# Altium project KNX_MCU_24CH_V1.2.PrjPcb
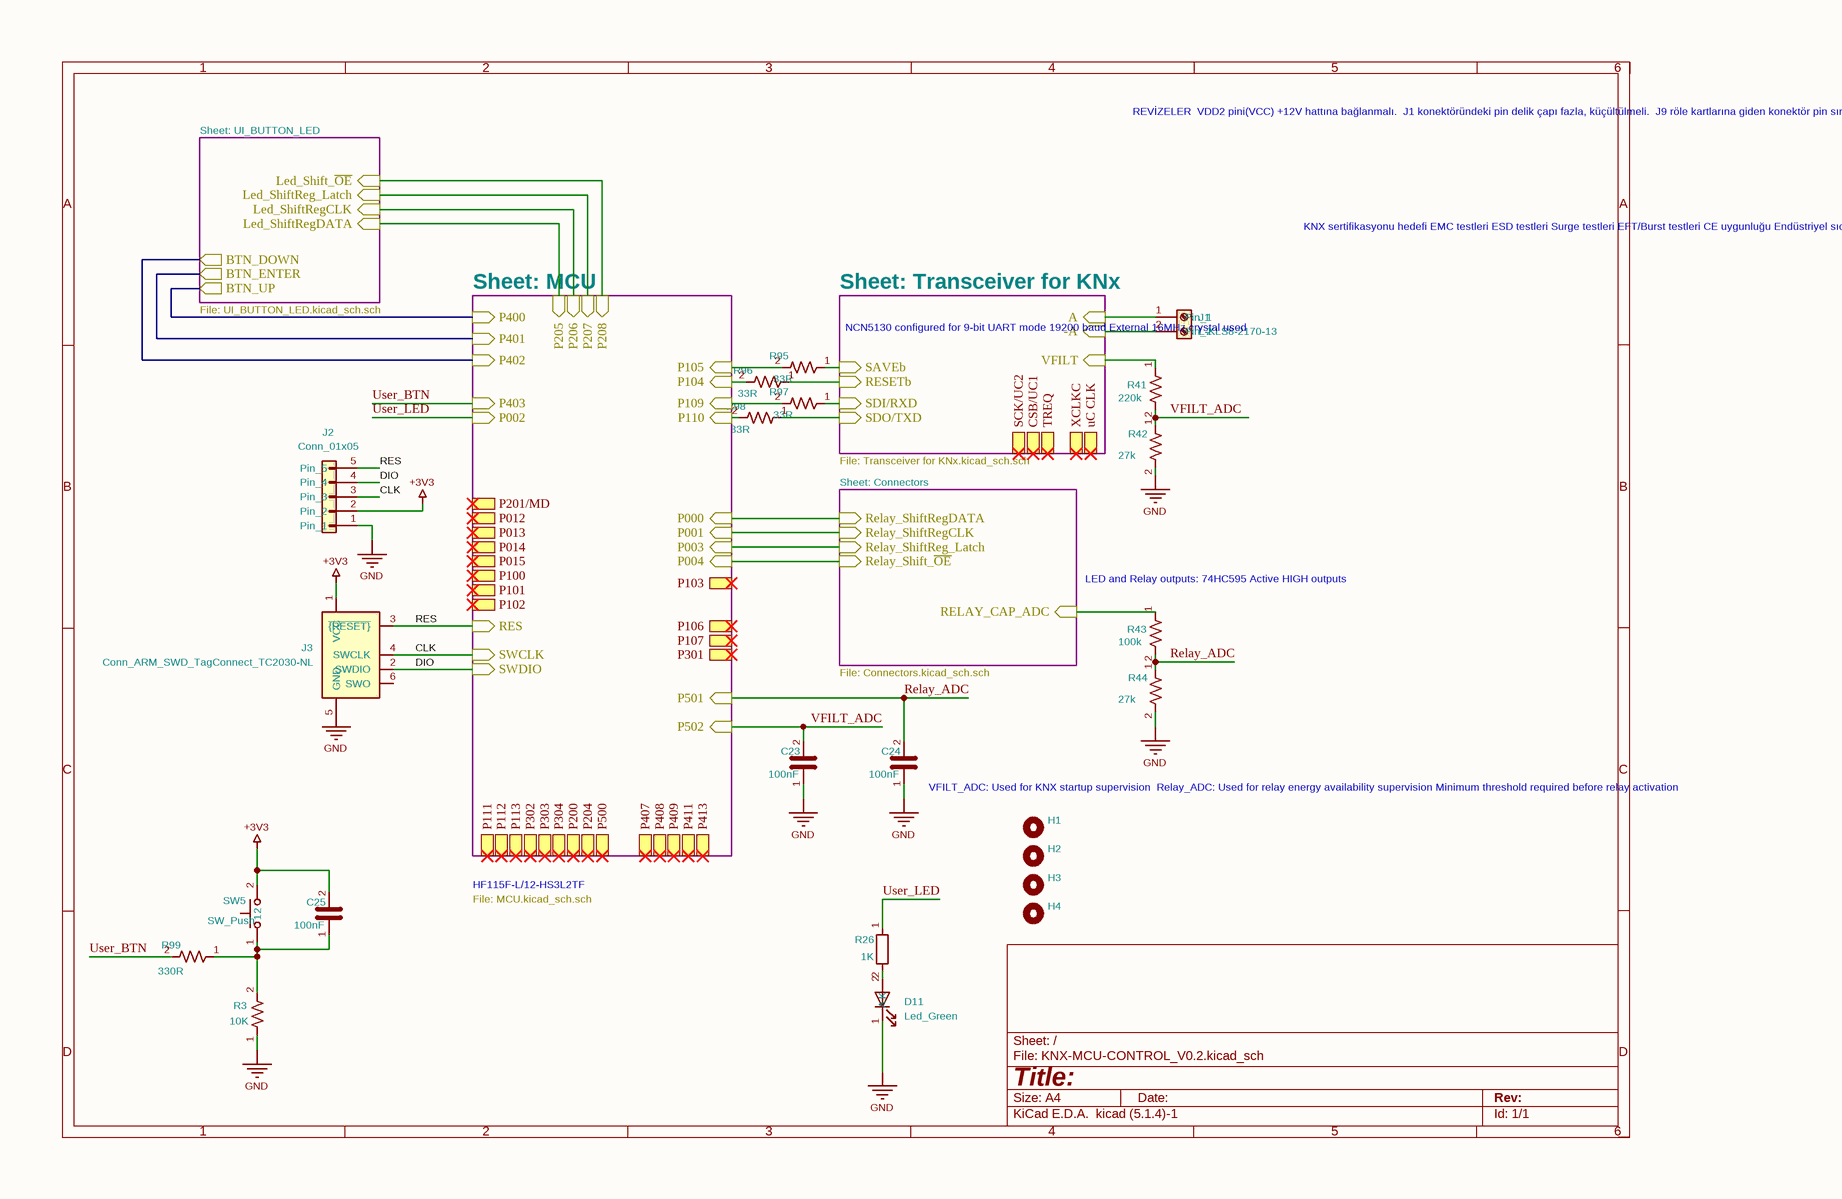
[diagram p0: KNX-MCU-CONTROL_V0.2.SchDoc]
5 sheets, 138 parts. Net scope: hierarchical (ports join the sheet entries above them; power ports are global).
Board file: KNX_MCU_24CH_V1.2.PcbDoc
Sheets:
  KNX-MCU-CONTROL_V0.2.SchDoc
    Transceiver for KNx = Transceiver for KNx.SchDoc
    Connectors = Connectors.SchDoc
    MCU = MCU.SchDoc
    UI_BUTTON_LED = UI_BUTTON_LED.SchDoc

## Sheet KNX-MCU-CONTROL_V0.2.SchDoc
size 297 x 209 mm

### Parts
C23  100nF  [C_0603_1608Metric]
C24  100nF  [C_0603_1608Metric]
C25  100nF  [C_0603_1608Metric]
D11  Led_Green  [LED_D3.0mm]
H1  YP-1132-20-0-N-0  [MountingHole_3mm]  (value not drawn)
H2  YP-1132-20-0-N-0  [MountingHole_3mm]  (value not drawn)
H3  YP-1132-20-0-N-0  [MountingHole_3mm]  (value not drawn)
H4  YP-1132-20-0-N-0  [MountingHole_3mm]  (value not drawn)
J1  L-KLS8-2170-13  [Samtec_HPM-02-01-x-S_Straight_1x02_Pitch5.08mm]
J2  Conn_01x05  [PinHeader_1x05_P2.54mm_Vertical]  (no BOM)
J3  Conn_ARM_SWD_TagConnect_TC2030-NL  [Tag-Connect_TC2030-IDC-NL_2x03_P1.27mm_Vertical]  (no BOM)
R3  10K  [R_0603_1608Metric]
R26  1K  [R_0603_1608Metric]
R41  220k  [R_0603_1608Metric]
R42  27k  [R_0603_1608Metric]
R43  100k  [R_0603_1608Metric]
R44  27k  [R_0603_1608Metric]
R95  33R  [R_0603_1608Metric]
R96  33R  [R_0603_1608Metric]
R97  33R  [R_0603_1608Metric]
R98  33R  [R_0603_1608Metric]
R99  330R  [R_0603_1608Metric]
SW5  SW_Push  [SW_SPST_Omron_B3FS-100xP]

### Sub-sheets
Connectors = Connectors.SchDoc: RELAY_CAP_ADC (in), Relay_ShiftRegCLK (in), Relay_ShiftRegDATA (in), Relay_Shift_~{OE} (in), Relay_ShiftReg_Latch (in)
MCU = MCU.SchDoc: P000 (in), P001 (in), P003 (in), P104 (in), P105 (in), P109 (in), P110 (in), P400 (in), P401 (in), P402 (in), P501 (in), RES (in), SWCLK (in), SWDIO (in), P004 (in), P205 (in), P206 (in), P207 (in), P208 (in), P403 (in), P002 (in), P502 (in), P012, P013, P014, P015, P100, P101, P102, P103, P106, P107, P301, P111, P112, P113, P302, P303, P304, P200, P204, P500, P407, P408, P409, P411, P413, P201/MD
Transceiver for KNx = Transceiver for KNx.SchDoc: RESETb (in), SAVEb (in), SDI/RXD (in), SDO/TXD (in), VFILT (in), A (in), -A (in), SCK/UC2, CSB/UC1, TREQ, XCLKC, uC CLK
UI_BUTTON_LED = UI_BUTTON_LED.SchDoc: BTN_DOWN (out), BTN_ENTER (out), BTN_UP (out), Led_ShiftRegCLK (in), Led_ShiftRegDATA (in), Led_ShiftReg_Latch (in), Led_Shift_~{OE} (in)

### Nets
+3V3: C25.2 J2.2(Pin_2) J3.1(VCC) SW5.2
GND: C23.1 C24.1 D11.1(K) J2.1(Pin_1) J3.5(GND) R3.1 R42.2 R44.2
-A: J1.2(Pin_2) ; sheet Transceiver for KNx/-A
A: J1.1(Pin_1) ; sheet Transceiver for KNx/A
BTN_DOWN: sheet MCU/P402, sheet UI_BUTTON_LED/BTN_DOWN
BTN_ENTER: sheet MCU/P401, sheet UI_BUTTON_LED/BTN_ENTER
BTN_UP: sheet MCU/P400, sheet UI_BUTTON_LED/BTN_UP
CLK: J2.3(Pin_3) J3.4(SWCLK) ; sheet MCU/SWCLK
DIO: J2.4(Pin_4) J3.2(SWDIO) ; sheet MCU/SWDIO
Led_ShiftRegDATA: sheet MCU/P205, sheet UI_BUTTON_LED/Led_ShiftRegDATA
P000: sheet Connectors/Relay_ShiftRegDATA, sheet MCU/P000
P001: sheet Connectors/Relay_ShiftRegCLK, sheet MCU/P001
P003: sheet Connectors/Relay_ShiftReg_Latch, sheet MCU/P003
P004: sheet Connectors/Relay_Shift_~{OE}, sheet MCU/P004
P104: R96.2 ; sheet MCU/P104
P105: R95.2 ; sheet MCU/P105
P109: R97.2 ; sheet MCU/P109
P110: R98.2 ; sheet MCU/P110
Relay_ADC: C24.2 R43.2 R44.1 ; sheet MCU/P501
RELAY_CAP_ADC: R43.1 ; sheet Connectors/RELAY_CAP_ADC
RES: J2.5(Pin_5) J3.3(~{{RESET}}) ; sheet MCU/RES
RESETb: R96.1 ; sheet Transceiver for KNx/RESETb
SAVEb: R95.1 ; sheet Transceiver for KNx/SAVEb
SDI/RXD: R97.1 ; sheet Transceiver for KNx/SDI/RXD
SDO/TXD: R98.1 ; sheet Transceiver for KNx/SDO/TXD
ShiftReg_Latch: sheet MCU/P207, sheet UI_BUTTON_LED/Led_ShiftReg_Latch
ShiftReg_~{{OE}}: sheet MCU/P208, sheet UI_BUTTON_LED/Led_Shift_~{OE}
ShiftRegCLK: sheet MCU/P206, sheet UI_BUTTON_LED/Led_ShiftRegCLK
User_BTN: R99.2 ; sheet MCU/P403
User_LED: R26.1 ; sheet MCU/P002
VFILT: R41.1 ; sheet Transceiver for KNx/VFILT
VFILT_ADC: C23.2 R41.2 R42.1 ; sheet MCU/P502
NetC25_1: C25.1 R3.2 R99.1 SW5.1
NetD11_2: D11.2(A) R26.2

Not connected (* = marked no-connect by the designer): J3 6(SWO)

### Notes on the sheet
- Sheet: UI_BUTTON_LED
- REVİZELER
  VDD2 pini(VCC) +12V hattına bağlanmalı.
  J1 konektöründeki pin delik çapı fazla, küçültülmeli.
  J9 röle kartlarına giden konektör pin sırası uyuşmuyor kontrol edilmeli.
  VFILT_ADC P500 den P502 ye bağlanmalı.
  16ch da kapasitör yetmiyor artırmak gerekli
  24ch da kapasitör bankası SMD kılıfı var mı bi bak.
- KNX sertifikasyonu hedefi
  EMC testleri
  ESD testleri
  Surge testleri
  EFT/Burst testleri
  CE uygunluğu
  Endüstriyel sıcaklık aralığı
  Uzun süreli saha kullanımı
  Fan-in akımı 20-40mA sınıfı düşünülüyor
  PCB'de geniş GND poligonları ve düşük EMI hedefleniyor
- File: UI_BUTTON_LED.kicad_sch.sch
- Sheet: MCU
- Sheet: Transceiver for KNx
- (near J1) NCN5130 configured for 9-bit UART mode
  19200 baud
  External 16MHz crystal used
- File: Transceiver for KNx.kicad_sch.sch
- Sheet: Connectors
- (near R43) LED and Relay outputs:
  74HC595
  Active HIGH outputs
- File: Connectors.kicad_sch.sch
- VFILT_ADC:
  Used for KNX startup supervision
  Relay_ADC:
  Used for relay energy availability supervision
  Minimum threshold required before relay activation
- File: MCU.kicad_sch.sch
- HF115F-L/12-HS3L2TF
- 1
- 2
- 3
- 4
- 5
- 6
- A
- B
- C
- D
- Title:
- File: KNX-MCU-CONTROL_V0.2.kicad_sch
- Sheet: /
- KiCad E.D.A.  kicad (5.1.4)-1
- Size: A4
- Date:
- Rev:
- Id: 1/1

### Library data of the parts
C23 C24 = C_1: Manufacturer Part Number: CL10B104KB8NNNC; Manufacturer: Samsung Electro-Mechanics; Value: 100nF; Footprint: Capacitor_SMD:C_0603_1608Metric
C25 = C_3: Manufacturer Part Number: CC0603KRX7R9BB104; Manufacturer: YAGEO; Value: 100nF; Footprint: Capacitor_SMD:C_0603_1608Metric
D11 = LED: Manufacturer Part Number: TZ-L2-03YYBYG1GDJ30-001; Manufacturer: TUOZHAN; Value: Led_Green; Footprint: LED_THT:LED_D3.0mm
H1-H4 = MountingHole: YP-1132 Geçmeli Yükseltme Parçası (3.2mm delik için) İki Tarafı Kilitli; Manufacturer: Altınkaya; Value: MountingHole; Footprint: MountingHole:MountingHole_3mm; Manufacturer Part Number: YP-1132-20-0-N-0
J1 = Screw_Terminal_01x02: Manufacturer: KLS ELECTRONIC; Manufacturer Part Number: L-KLS8-2170-13; Value: L-KLS8-2170-13; Footprint: Connector_Samtec_HPM_THT:Samtec_HPM-02-01-x-S_Straight_1x02_Pitch5.08mm
R3 = R_US: Manufacturer Part Number: FRC0603J103TS; Manufacturer: FOJAN; Value: 10K; Footprint: Resistor_SMD:R_0603_1608Metric
R26 = R_7: Manufacturer Part Number: SCR0603J1K; Manufacturer: VO; Value: 1K; Footprint: Resistor_SMD:R_0603_1608Metric
R41 = R_US: Manufacturer Part Number: ERJ3EKF2203V; Manufacturer: PANASONIC; Value: 220k; Footprint: Resistor_SMD:R_0603_1608Metric
R42 R44 = R_US: Manufacturer Part Number: ERJ3EKF2702V; Manufacturer: PANASONIC; Value: 27k; Footprint: Resistor_SMD:R_0603_1608Metric
R43 = R_US: Manufacturer Part Number: RC0603FR-07100KL; Manufacturer: YAGEO; Value: 100k; Footprint: Resistor_SMD:R_0603_1608Metric
R95-R98 = R_US: Manufacturer Part Number: 0603SAF330JT5E; Manufacturer: ROYALOHM; Value: 33R; Footprint: Resistor_SMD:R_0603_1608Metric
R99 = R_US: Manufacturer Part Number: FRC0603J331 TS; Manufacturer: FOJAN; Value: 330R; Footprint: Resistor_SMD:R_0603_1608Metric
SW5 = SW_Push: Manufacturer Part Number: KH-12X12X8H-SMT; Manufacturer: kinghelm; Value: SW_Push; Footprint: Button_Switch_SMD:SW_SPST_Omron_B3FS-100xP
J2 = Conn_01x05: Value: Conn_01x05; Footprint: Connector_PinHeader_2.54mm:PinHeader_1x05_P2.54mm_Vertical
J3 = Conn_ARM_SWD_TagConnect_TC2030-NL: Value: Conn_ARM_SWD_TagConnect_TC2030-NL; Footprint: Connector:Tag-Connect_TC2030-IDC-NL_2x03_P1.27mm_Vertical

## Sheet Transceiver for KNx.SchDoc
size 297 x 209 mm
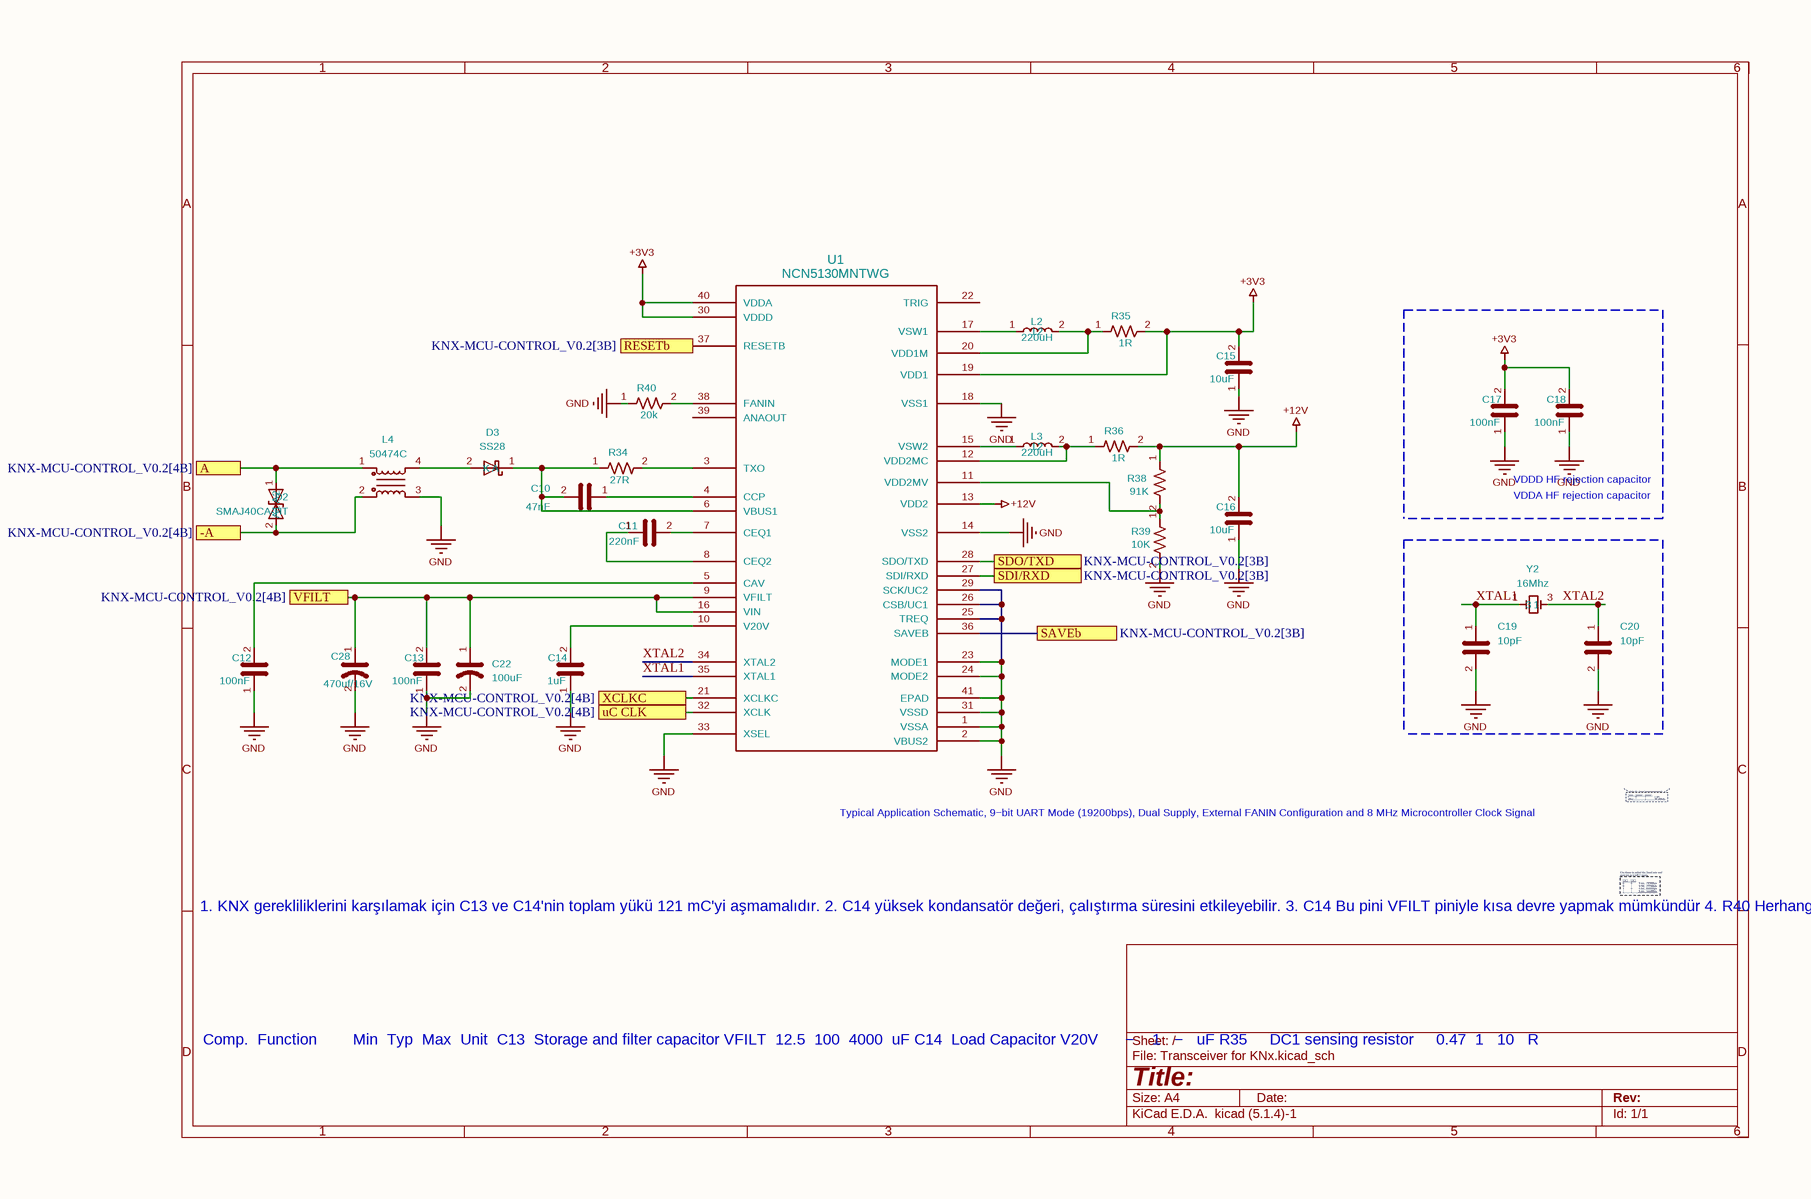
[diagram p1: Transceiver for KNx.SchDoc]

### Parts
C10  47nF  [C_0603_1608Metric]
C11  220nF  [C_0603_1608Metric]
C12  100nF  [C_0603_1608Metric]
C13  100nF  [C_0603_1608Metric]
C14  1uF  [C_0603_1608Metric]
C15  10uF  [C_0805_2012Metric]
C16  10uF  [C_0805_2012Metric]
C17  100nF  [C_0603_1608Metric]
C18  100nF  [C_0603_1608Metric]
C19  10pF  [C_0603_1608Metric]
C20  10pF  [C_0603_1608Metric]
C22  100uF  [CP_Elec_8x10]
C28  470uf/16V  [CP_Elec_8x10]
D2  SMAJ40CA-HT  [D_SMA]
D3  SS28  [D_SMA]
L2  220uH  [L_APV_ANR6028]
L3  220uH  [L_APV_ANR6028]
L4  50474C  [L_CommonMode_50474C_7.5x5.9mm]
R34  27R  [R_2512_6332Metric]
R35  1R  [R_0805_2012Metric]
R36  1R  [R_0805_2012Metric]
R38  91K  [R_0603_1608Metric]
R39  10K  [R_0603_1608Metric]
R40  20k  [R_0603_1608Metric]
U1  NCN5130MNTWG  [QFN40_485AU-01_ONS]
Y2  16Mhz  [Crystal_SMD_SeikoEpson_FA238V-4Pin_3.2x2.5mm]

### Ports
-A (see KNX-MCU-CONTROL_V0.2[4B]), A (see KNX-MCU-CONTROL_V0.2[4B]), RESETb (see KNX-MCU-CONTROL_V0.2[3B]), SAVEb (see KNX-MCU-CONTROL_V0.2[3B]), SDI/RXD (see KNX-MCU-CONTROL_V0.2[3B]), SDO/TXD (see KNX-MCU-CONTROL_V0.2[3B]), uC CLK (see KNX-MCU-CONTROL_V0.2[4B]), VFILT (see KNX-MCU-CONTROL_V0.2[4B]), XCLKC (see KNX-MCU-CONTROL_V0.2[4B])

### Nets
+3V3: C15.2 C17.2 C18.2 R35.2 U1.19(VDD1) U1.30(VDDD) U1.40(VDDA)
+12V: C16.2 R36.2 R38.1 U1.13(VDD2)
GND: C12.1 C13.1 C14.1 C15.1 C16.1 C17.1 C18.1 C19.2 C20.2 C22.2 C28.2 L4.3 R39.2 R40.1 U1.1(VSSA) U1.2(VBUS2) U1.14(VSS2) U1.18(VSS1) U1.23(MODE1) U1.24(MODE2) U1.25(TREQ) U1.26(CSB/UC1) U1.29(SCK/UC2) U1.31(VSSD) U1.33(XSEL) U1.41(EPAD)
-A: D2.2(A2) L4.2 ; port -A
A: D2.1(A1) L4.1 ; port A
RESETb: U1.37(RESETB) ; port RESETb
SAVEb: U1.36(SAVEB) ; port SAVEb
SDI/RXD: U1.27(SDI/RXD) ; port SDI/RXD
SDO/TXD: U1.28(SDO/TXD) ; port SDO/TXD
uC CLK: U1.32(XCLK) ; port uC CLK
VFILT: C13.2 C22.1 C28.1 U1.9(VFILT) U1.16(VIN) ; port VFILT
XCLKC: U1.21(XCLKC) ; port XCLKC
XTAL1: C19.1 U1.35(XTAL1) Y2.1
XTAL2: C20.1 U1.34(XTAL2) Y2.3
NetC10_1: C10.1 U1.4(CCP)
NetC10_2: C10.2 D3.1(K) R34.1 U1.6(VBUS1)
NetC11_1: C11.1 U1.8(CEQ2)
NetC11_2: C11.2 U1.7(CEQ1)
NetC12_2: C12.2 U1.5(CAV)
NetC14_2: C14.2 U1.10(V20V)
NetD3_2: D3.2(A) L4.4
NetL2_1: L2.1 U1.17(VSW1)
NetL2_2: L2.2 R35.1 U1.20(VDD1M)
NetL3_1: L3.1 U1.15(VSW2)
NetL3_2: L3.2 R36.1 U1.12(VDD2MC)
NetR34_2: R34.2 U1.3(TXO)
NetR38_2: R38.2 R39.1 U1.11(VDD2MV)
NetR40_2: R40.2 U1.38(FANIN)

Not connected (* = marked no-connect by the designer): U1 22(TRIG) 39(ANAOUT)

### Notes on the sheet
- VDDA HF rejection capacitor
- VDDD HF rejection capacitor
- Typical Application Schematic, 9−bit UART Mode (19200bps), Dual Supply, External FANIN Configuration
  and 8 MHz Microcontroller Clock Signal
- 1. KNX gerekliliklerini karşılamak için C13 ve C14'nin toplam yükü 121 mC'yi aşmamalıdır.
  2. C14 yüksek kondansatör değeri, çalıştırma süresini etkileyebilir.
  3. C14 Bu pini VFILT piniyle kısa devre yapmak mümkündür
  4. R40 Herhangi bir direnç bağlanmamışsa veya 3,3 V'a çekilmemişse, KNX cihazı 10 mA'lık bir veri
  yolu yükü olarak sertifikalandırılmalıdır. Toprağa kısa devre yapıldığında, KNX cihazı
  20 mA'lık bir veri yolu yükü olarak sertifikalandırılmalıdır. Toprağa 10 k ile 93,1 k arasında
  bir direnç bağlanırsa, cihaz 10 mA (42,2 k), 20 mA (20 k), 30 mA (13,3 k) veya 40 mA (10 k) bus yükü olarak sertifikalandırılmalıdır.
- Comp. 	Function							 Min	 Typ	 Max 	Unit
  C13 	Storage and filter capacitor VFILT 	12.5 	100 	4000 	uF
  C14 	Load Capacitor V20V					 − 		 1 		− 		uF
  R35	    DC1 sensing resistor 				0.47	 1 		10  	R
- 1
- 2
- 3
- 4
- 5
- 6
- A
- B
- C
- D
- Title:
- File: Transceiver for KNx.kicad_sch
- Sheet: /
- KiCad E.D.A.  kicad (5.1.4)-1
- Size: A4
- Date:
- Rev:
- Id: 1/1

### Library data of the parts
C10 = C_3: Manufacturer Part Number: CL10B473KB8NNNC; Manufacturer: SAMSUNG; Value: 47nF; Footprint: Capacitor_SMD:C_0603_1608Metric
C11 = C_3: Manufacturer Part Number: CL10B224KB8NNNC; Manufacturer: Samsung Electro-Mechanics; Value: 220nF; Footprint: Capacitor_SMD:C_0603_1608Metric
C12 C13 C17 C18 = C_1: as C23 on sheet KNX-MCU-CONTROL_V0.2; Value: 100nF; Footprint: Capacitor_SMD:C_0603_1608Metric
C14 = C_3: Manufacturer Part Number: CL10B105KP8NNNC; Manufacturer: Samsung Electro-Mechanics; Value: 1uF; Footprint: Capacitor_SMD:C_0603_1608Metric
C15 C16 = C_3: Manufacturer Part Number: CL21B106KOQNNNE; Manufacturer: Samsung Electro-Mechanics; Value: 10uF; Footprint: Capacitor_SMD:C_0805_2012Metric
C19 C20 = 20pF_0402_50V_5%: Manufacturer Part Number: CL10C100JB8NNNC; Manufacturer: Samsung Electro-Mechanics; Value: 10pF; Footprint: Capacitor_SMD:C_0603_1608Metric
C22 = C_US: Manufacturer Part Number: CD035M101F10PKKKV00A; Manufacturer: SUSCON; Value: 100uF; Footprint: Capacitor_SMD:CP_Elec_8x10
C28 = C_US: CAP.EL.470uF 16V 8x10 105C SMD; Manufacturer Part Number: EEEFK1C471P; Manufacturer: PANASONIC(EUROPE); Value: 470uf/16V; Footprint: Capacitor_SMD:CP_Elec_8x10
D2 = D_TVS: Manufacturer: HOTTECH; Manufacturer Part Number: SMAJ40CA-HT; Value: SMAJ40CA-HT; Footprint: Diode_SMD:D_SMA
D3 = SS28: Manufacturer Part Number: SS18-HT; Manufacturer: HOTTECH; Value: SS28; Footprint: Diode_SMD:D_SMA
L2 L3 = L: Manufacturer Part Number: NR6028-221M; Manufacturer: CORE MASTER; Value: 220uH; Footprint: Inductor_SMD:L_APV_ANR6028
L4 = Choke_Wurth_WE-CNSW_744232090: Manufacturer: muRata; Manufacturer Part Number: 50474C; Value: 50474C; Footprint: Me_Library:L_CommonMode_50474C_7.5x5.9mm
R34 = R_US: Manufacturer Part Number: HP122WF270JT4E; Manufacturer: ROYALOHM; Value: 27R; Footprint: Resistor_SMD:R_2512_6332Metric
R35 R36 = R_US: Manufacturer Part Number: ERJ6RQF1R0V; Manufacturer: PANASONIC; Value: 1R; Footprint: Resistor_SMD:R_0805_2012Metric
R38 = R_US: Manufacturer Part Number: 0603SAF9102T5E; Manufacturer: ROYALOHM; Value: 91K; Footprint: Resistor_SMD:R_0603_1608Metric
R39 = R_US: Manufacturer Part Number: PS03W4F1002T5E; Manufacturer: ROYALOHM; Value: 10K; Footprint: Resistor_SMD:R_0603_1608Metric
R40 = R_US: Manufacturer Part Number: 0603SAF2002T5E; Manufacturer: ROYALOHM; Value: 20k; Footprint: Resistor_SMD:R_0603_1608Metric
U1 = NCN5130MNTWG: Manufacturer: onsemi; Manufacturer Part Number: NCN5130MNTWG; Value: NCN5130MNTWG; Footprint: Me_Library:QFN40_485AU-01_ONS
Y2 = Crystal: Manufacturer Part Number: RH100-16.000-10-1010-EXT; Manufacturer: RALTRON; Value: 16Mhz; Footprint: Crystal:Crystal_SMD_SeikoEpson_FA238V-4Pin_3.2x2.5mm

## Sheet Connectors.SchDoc
size 209 x 148 mm
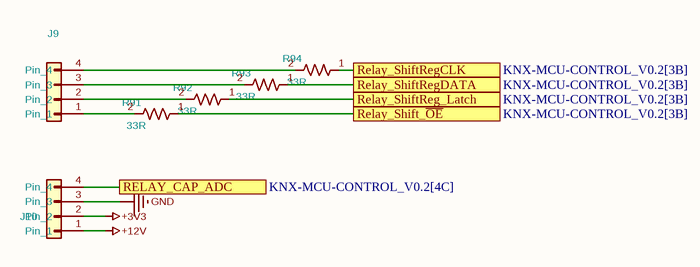
[diagram p2: Connectors.SchDoc]

### Parts
J9  DK501-1X6SBT-3X13MM  [PinHeader_1x04_P2.54mm_Vertical]  (value not drawn)
J10  DK501-1X6SBT-3X13MM  [PinHeader_1x04_P2.54mm_Vertical]  (value not drawn)
R91  33R  [R_0603_1608Metric]
R92  33R  [R_0603_1608Metric]
R93  33R  [R_0603_1608Metric]
R94  33R  [R_0603_1608Metric]

### Ports
RELAY_CAP_ADC (see KNX-MCU-CONTROL_V0.2[4C]), Relay_Shift_~{OE} (see KNX-MCU-CONTROL_V0.2[3B]), Relay_ShiftReg_Latch (see KNX-MCU-CONTROL_V0.2[3B]), Relay_ShiftRegCLK (see KNX-MCU-CONTROL_V0.2[3B]), Relay_ShiftRegDATA (see KNX-MCU-CONTROL_V0.2[3B])

### Nets
+3V3: J10.2(Pin_2)
+12V: J10.1(Pin_1)
GND: J10.3(Pin_3)
P000: R93.1 ; port Relay_ShiftRegDATA
P001: R94.1 ; port Relay_ShiftRegCLK
P003: R92.1 ; port Relay_ShiftReg_Latch
P004: R91.1 ; port Relay_Shift_~{OE}
RELAY_CAP_ADC: J10.4(Pin_4) ; port RELAY_CAP_ADC
NetJ9_1: J9.1(Pin_1) R91.2
NetJ9_2: J9.2(Pin_2) R92.2
NetJ9_3: J9.3(Pin_3) R93.2
NetJ9_4: J9.4(Pin_4) R94.2

### Notes on the sheet
- 1
- 2
- 3
- 4
- A
- B
- Title:
- File: Connectors.kicad_sch
- Sheet: /
- C
- KiCad E.D.A.  kicad (5.1.4)-1
- Size: A5
- Date:
- Rev:
- Id: 1/1

### Library data of the parts
J9 J10 = Conn_01x04: PIN HEADER 6PIN(1x6) 2.54mm THT V/T 3X13MM; Manufacturer: OEM; Value: Conn_01x04; Footprint: Connector_PinHeader_2.54mm:PinHeader_1x04_P2.54mm_Vertical; Manufacturer Part Number: DK501-1X6SBT-3X13MM
R91-R94 = R_US: Manufacturer Part Number: RC0603JR-0733RL; Manufacturer: YAGEO; Value: 33R; Footprint: Resistor_SMD:R_0603_1608Metric

## Sheet MCU.SchDoc
size 297 x 209 mm
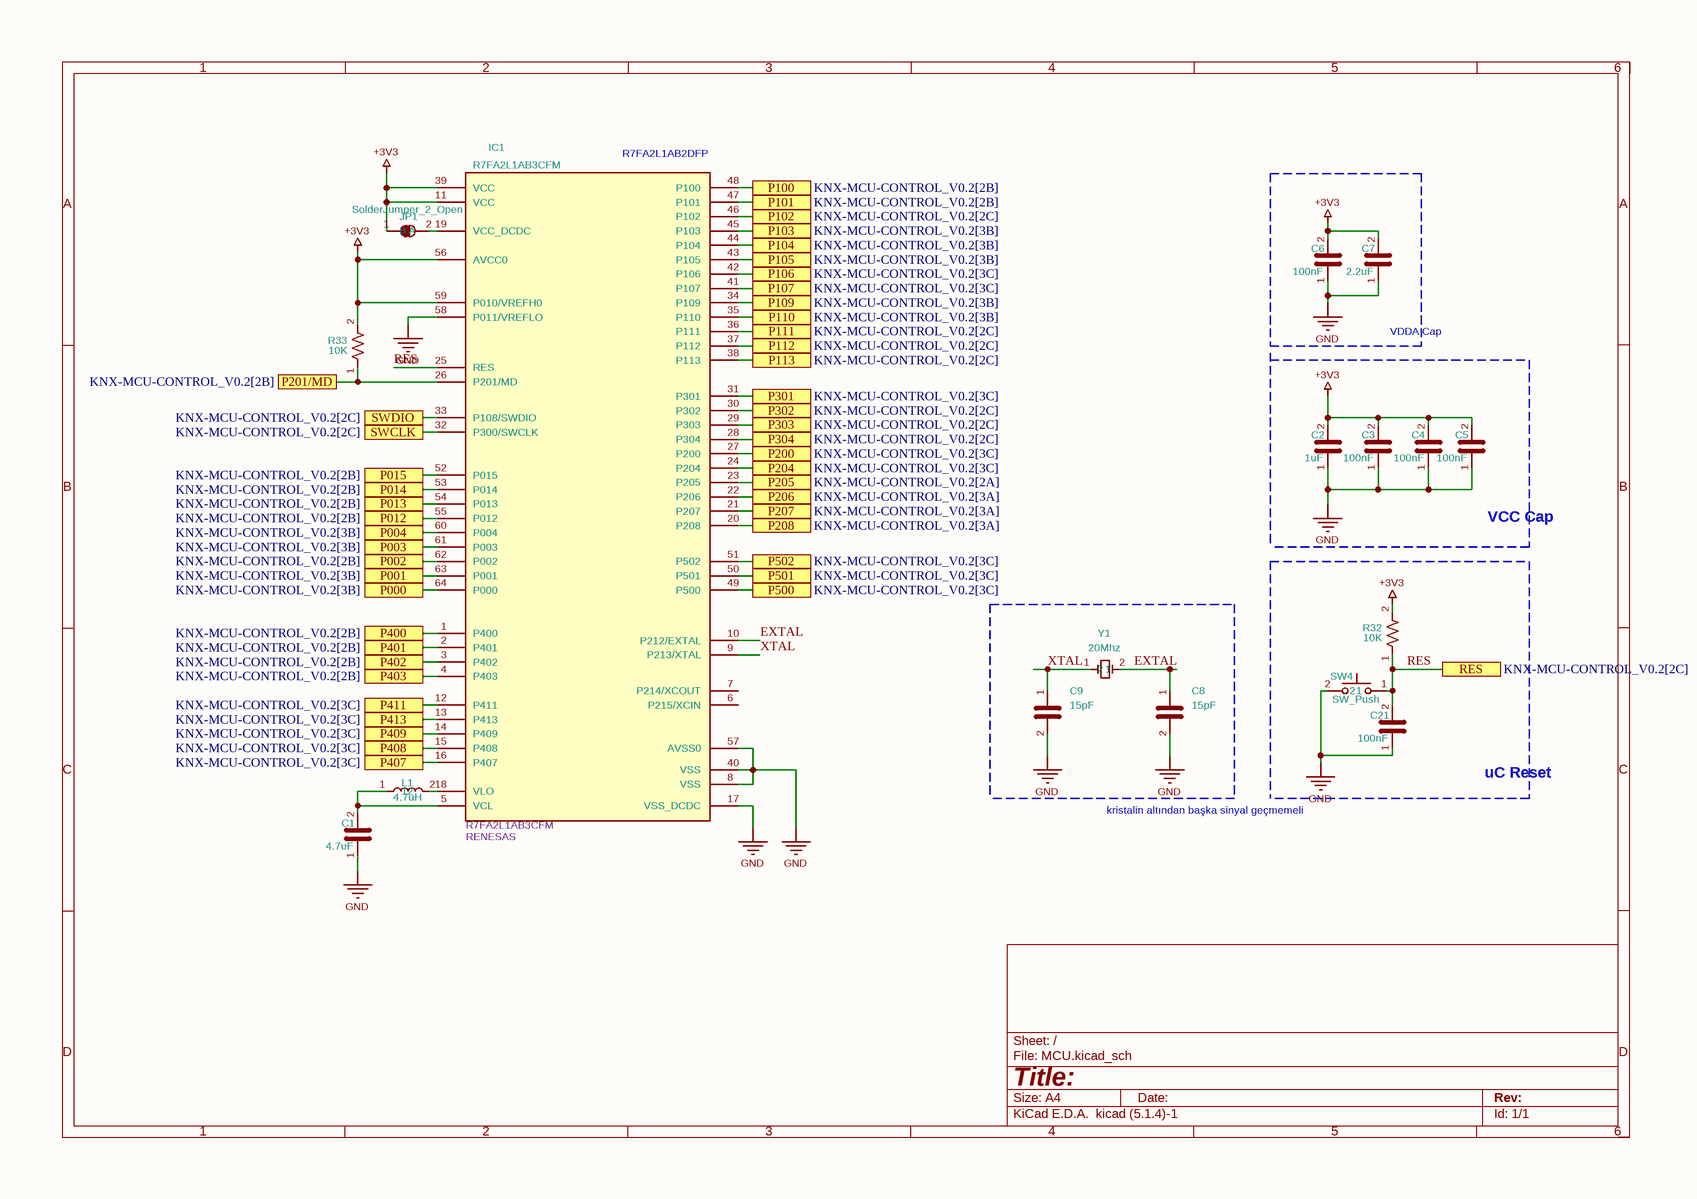
[diagram p3: MCU.SchDoc]

### Parts
C1  4.7uF  [C_0603_1608Metric]
C2  1uF  [C_0603_1608Metric]
C3  100nF  [C_0603_1608Metric]
C4  100nF  [C_0603_1608Metric]
C5  100nF  [C_0603_1608Metric]
C6  100nF  [C_0603_1608Metric]
C7  2.2uF  [C_0603_1608Metric]
C8  15pF  [C_0603_1608Metric]
C9  15pF  [C_0603_1608Metric]
C21  100nF  [C_0603_1608Metric]
IC1  Manufacturer: RENESAS  [LQFP-64_10x10mm_P0.5mm]  (hidden comment: R7FA2L1AB3CFM)
JP1  SolderJumper_2_Open  [SolderJumper-2_P1.3mm_Open_TrianglePad1.0x1.5mm]  (no BOM)
L1  4.7uH  [L_APV_ANR5012]
R32  10K  [R_0603_1608Metric]
R33  10K  [R_0603_1608Metric]
SW4  value SW_Push  [SW_SPST_CK_RS282G05A3]  (hidden comment: HX 3x6x2.5A-2.5N)
Y1  20Mhz  [Crystal_SMD_SeikoEpson_FA238-4Pin_3.2x2.5mm]

### Blocks framed on the sheet
VDDA Cap: C6 C7
uC Reset: C21 R32 SW4

### Ports
P000 (see KNX-MCU-CONTROL_V0.2[3B]), P001 (see KNX-MCU-CONTROL_V0.2[3B]), P002 (see KNX-MCU-CONTROL_V0.2[2B]), P003 (see KNX-MCU-CONTROL_V0.2[3B]), P004 (see KNX-MCU-CONTROL_V0.2[3B]), P012 (see KNX-MCU-CONTROL_V0.2[2B]), P013 (see KNX-MCU-CONTROL_V0.2[2B]), P014 (see KNX-MCU-CONTROL_V0.2[2B]), P015 (see KNX-MCU-CONTROL_V0.2[2B]), P100 (see KNX-MCU-CONTROL_V0.2[2B]), P101 (see KNX-MCU-CONTROL_V0.2[2B]), P102 (see KNX-MCU-CONTROL_V0.2[2C]), P103 (see KNX-MCU-CONTROL_V0.2[3B]), P104 (see KNX-MCU-CONTROL_V0.2[3B]), P105 (see KNX-MCU-CONTROL_V0.2[3B]), P106 (see KNX-MCU-CONTROL_V0.2[3C]), P107 (see KNX-MCU-CONTROL_V0.2[3C]), P109 (see KNX-MCU-CONTROL_V0.2[3B]), P110 (see KNX-MCU-CONTROL_V0.2[3B]), P111 (see KNX-MCU-CONTROL_V0.2[2C]), P112 (see KNX-MCU-CONTROL_V0.2[2C]), P113 (see KNX-MCU-CONTROL_V0.2[2C]), P200 (see KNX-MCU-CONTROL_V0.2[3C]), P201/MD (see KNX-MCU-CONTROL_V0.2[2B]), P204 (see KNX-MCU-CONTROL_V0.2[3C]), P205 (see KNX-MCU-CONTROL_V0.2[2A]), P206 (see KNX-MCU-CONTROL_V0.2[3A]), P207 (see KNX-MCU-CONTROL_V0.2[3A]), P208 (see KNX-MCU-CONTROL_V0.2[3A]), P301 (see KNX-MCU-CONTROL_V0.2[3C]), P302 (see KNX-MCU-CONTROL_V0.2[2C]), P303 (see KNX-MCU-CONTROL_V0.2[2C]), P304 (see KNX-MCU-CONTROL_V0.2[2C]), P400 (see KNX-MCU-CONTROL_V0.2[2B]), P401 (see KNX-MCU-CONTROL_V0.2[2B]), P402 (see KNX-MCU-CONTROL_V0.2[2B]), P403 (see KNX-MCU-CONTROL_V0.2[2B]), P407 (see KNX-MCU-CONTROL_V0.2[3C]), P408 (see KNX-MCU-CONTROL_V0.2[3C]), P409 (see KNX-MCU-CONTROL_V0.2[3C]), P411 (see KNX-MCU-CONTROL_V0.2[3C]), P413 (see KNX-MCU-CONTROL_V0.2[3C]), P500 (see KNX-MCU-CONTROL_V0.2[3C]), P501 (see KNX-MCU-CONTROL_V0.2[3C]), P502 (see KNX-MCU-CONTROL_V0.2[3C]), RES (see KNX-MCU-CONTROL_V0.2[2C]), SWCLK (see KNX-MCU-CONTROL_V0.2[2C]), SWDIO (see KNX-MCU-CONTROL_V0.2[2C])

### Nets
+3V3: C2.2 C3.2 C4.2 C5.2 C6.2 C7.2 IC1.11(VCC) IC1.39(VCC) IC1.56(AVCC0) IC1.59(P010/VREFH0) JP1.1(A) R32.2 R33.2
GND: C1.1 C2.1 C3.1 C4.1 C5.1 C6.1 C7.1 C8.2 C9.2 C21.1 IC1.8(VSS) IC1.17(VSS_DCDC) IC1.40(VSS) IC1.57(AVSS0) IC1.58(P011/VREFLO) SW4.2
BTN_DOWN: IC1.3(P402) ; port P402
BTN_ENTER: IC1.2(P401) ; port P401
BTN_UP: IC1.1(P400) ; port P400
CLK: IC1.32(P300/SWCLK) ; port SWCLK
DIO: IC1.33(P108/SWDIO) ; port SWDIO
EXTAL: C8.1 IC1.10(P212/EXTAL) Y1.2
Led_ShiftRegDATA: IC1.23(P205) ; port P205
P000: IC1.64(P000) ; port P000
P001: IC1.63(P001) ; port P001
P003: IC1.61(P003) ; port P003
P004: IC1.60(P004) ; port P004
P012: IC1.55(P012) ; port P012
P013: IC1.54(P013) ; port P013
P014: IC1.53(P014) ; port P014
P015: IC1.52(P015) ; port P015
P100: IC1.48(P100) ; port P100
P101: IC1.47(P101) ; port P101
P102: IC1.46(P102) ; port P102
P103: IC1.45(P103) ; port P103
P104: IC1.44(P104) ; port P104
P105: IC1.43(P105) ; port P105
P106: IC1.42(P106) ; port P106
P107: IC1.41(P107) ; port P107
P109: IC1.34(P109) ; port P109
P110: IC1.35(P110) ; port P110
P111: IC1.36(P111) ; port P111
P112: IC1.37(P112) ; port P112
P113: IC1.38(P113) ; port P113
P200: IC1.27(P200) ; port P200
P201/MD: IC1.26(P201/MD) R33.1 ; port P201/MD
P204: IC1.24(P204) ; port P204
P301: IC1.31(P301) ; port P301
P302: IC1.30(P302) ; port P302
P303: IC1.29(P303) ; port P303
P304: IC1.28(P304) ; port P304
P407: IC1.16(P407) ; port P407
P408: IC1.15(P408) ; port P408
P409: IC1.14(P409) ; port P409
P411: IC1.12(P411) ; port P411
P413: IC1.13(P413) ; port P413
P500: IC1.49(P500) ; port P500
Relay_ADC: IC1.50(P501) ; port P501
RES: C21.2 IC1.25(RES) R32.1 SW4.1 ; port RES
ShiftReg_Latch: IC1.21(P207) ; port P207
ShiftReg_~{{OE}}: IC1.20(P208) ; port P208
ShiftRegCLK: IC1.22(P206) ; port P206
User_BTN: IC1.4(P403) ; port P403
User_LED: IC1.62(P002) ; port P002
VFILT_ADC: IC1.51(P502) ; port P502
XTAL: C9.1 IC1.9(P213/XTAL) Y1.1
NetC1_2: C1.2 IC1.5(VCL) L1.1
NetIC1_18: IC1.18(VLO) L1.2
NetIC1_19: IC1.19(VCC_DCDC) JP1.2(B)

Not connected (* = marked no-connect by the designer): IC1 6(P215/XCIN) 7(P214/XCOUT)

### Notes on the sheet
- (near IC1) R7FA2L1AB2DFP
- VCC Cap
- kristalin altından başka sinyal geçmemeli
- 1
- 2
- 3
- 4
- 5
- 6
- A
- B
- C
- D
- Title:
- File: MCU.kicad_sch
- Sheet: /
- KiCad E.D.A.  kicad (5.1.4)-1
- Size: A4
- Date:
- Rev:
- Id: 1/1

### Library data of the parts
C1 = C_3: Manufacturer Part Number: CL10B475KQ8NQNC; Manufacturer: Samsung Electro-Mechanics; Value: 4.7uF; Footprint: Capacitor_SMD:C_0603_1608Metric
C2 = C_3: as C14 on sheet Transceiver for KNx; Value: 1uF; Footprint: Capacitor_SMD:C_0603_1608Metric
C3-C6 C21 = C_3: as C25 on sheet KNX-MCU-CONTROL_V0.2; Value: 100nF; Footprint: Capacitor_SMD:C_0603_1608Metric
C7 = C_3: Manufacturer Part Number: CL10B225KP8NNNC; Manufacturer: Samsung Electro-Mechanics; Value: 2.2uF; Footprint: Capacitor_SMD:C_0603_1608Metric
C8 C9 = 20pF_0402_50V_5%: Manufacturer Part Number: CL10C150JB8NNNC; Manufacturer: Samsung Electro-Mechanics; Value: 15pF; Footprint: Capacitor_SMD:C_0603_1608Metric
L1 = L: Manufacturer: VIKING; Manufacturer Part Number: PCD0302MT4R7; Value: 4.7uH; Footprint: Inductor_SMD:L_APV_ANR5012
R32 R33 = R_US: as R3 on sheet KNX-MCU-CONTROL_V0.2; Value: 10K; Footprint: Resistor_SMD:R_0603_1608Metric
SW4 = SW_Push: SWITCH TACTILE SPST 250gf SMD; Manufacturer: hanxia; Manufacturer Part Number: HX 3x6x2.5A-2.5N; Footprint: Button_Switch_SMD:SW_SPST_CK_RS282G05A3
Y1 = Crystal: Manufacturer Part Number: FL3P2X2P5SSC; Manufacturer: RALTRON; Value: 20Mhz; Footprint: Crystal:Crystal_SMD_SeikoEpson_FA238-4Pin_3.2x2.5mm
IC1 = R7FA2L1AB3CFM: Manufacturer Part Number: R7FA2L1AB3CFM; Value: R7FA2L1AB3CFM; Footprint: Package_QFP:LQFP-64_10x10mm_P0.5mm
JP1 = SolderJumper_2_Open: Value: SolderJumper_2_Open; Footprint: Jumper:SolderJumper-2_P1.3mm_Open_TrianglePad1.0x1.5mm

## Sheet UI_BUTTON_LED.SchDoc
size 297 x 209 mm
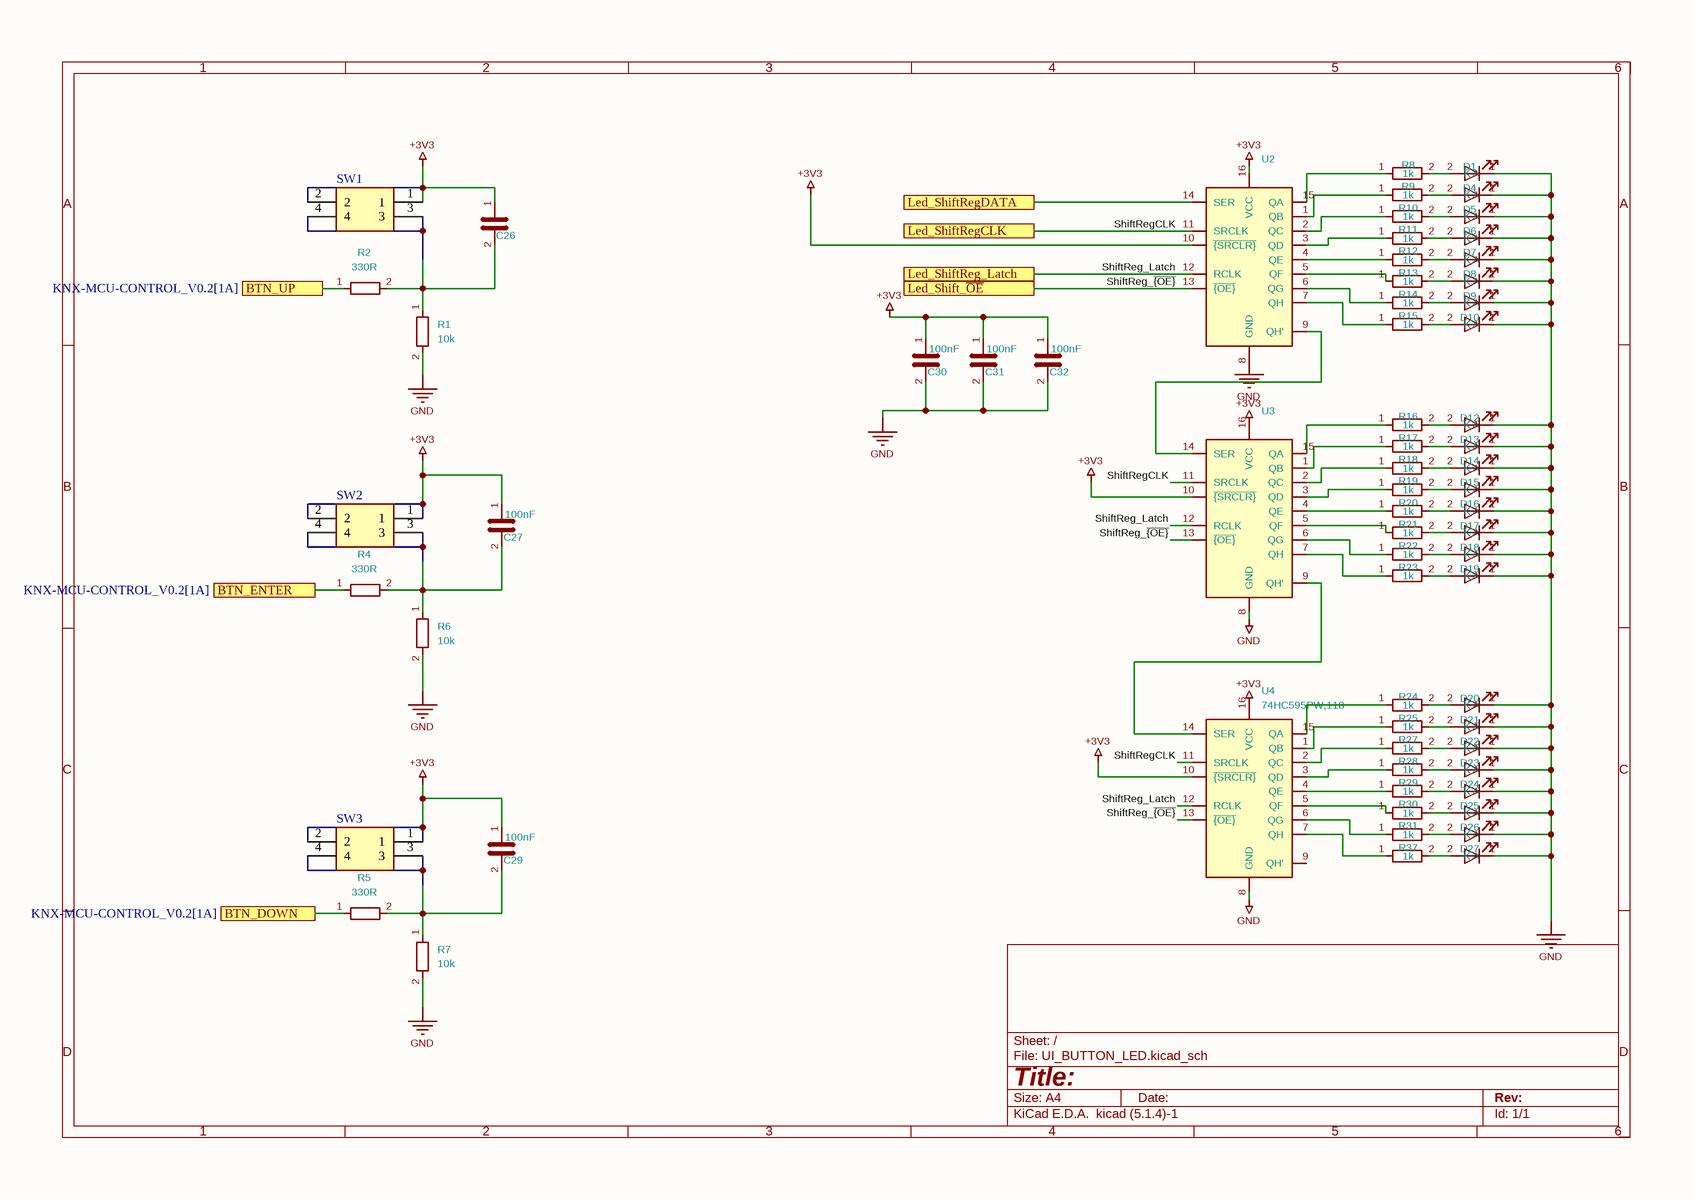
[diagram p4: UI_BUTTON_LED.SchDoc]

### Parts
C26  100nF  [C_0603_1608Metric]  (value not drawn)
C27  100nF  [C_0603_1608Metric]
C29  100nF  [C_0603_1608Metric]
C30  100nF  [C_0603_1608Metric]
C31  100nF  [C_0603_1608Metric]
C32  100nF  [C_0603_1608Metric]
D1  LED  [LED_0603_1608Metric]  (value not drawn)
D4  LED  [LED_0603_1608Metric]  (value not drawn)
D5  LED  [LED_0603_1608Metric]  (value not drawn)
D6  LED  [LED_0603_1608Metric]  (value not drawn)
D7  LED  [LED_0603_1608Metric]  (value not drawn)
D8  LED  [LED_0603_1608Metric]  (value not drawn)
D9  LED  [LED_0603_1608Metric]  (value not drawn)
D10  LED  [LED_0603_1608Metric]  (value not drawn)
D12  LED  [LED_0603_1608Metric]  (value not drawn)
D13  LED  [LED_0603_1608Metric]  (value not drawn)
D14  LED  [LED_0603_1608Metric]  (value not drawn)
D15  LED  [LED_0603_1608Metric]  (value not drawn)
D16  LED  [LED_0603_1608Metric]  (value not drawn)
D17  LED  [LED_0603_1608Metric]  (value not drawn)
D18  LED  [LED_0603_1608Metric]  (value not drawn)
D19  LED  [LED_0603_1608Metric]  (value not drawn)
D20  LED  [LED_0603_1608Metric]  (value not drawn)
D21  LED  [LED_0603_1608Metric]  (value not drawn)
D22  LED  [LED_0603_1608Metric]  (value not drawn)
D23  LED  [LED_0603_1608Metric]  (value not drawn)
D24  LED  [LED_0603_1608Metric]  (value not drawn)
D25  LED  [LED_0603_1608Metric]  (value not drawn)
D26  LED  [LED_0603_1608Metric]  (value not drawn)
D27  LED  [LED_0603_1608Metric]  (value not drawn)
R1  10k  [R_0603_1608Metric]
R2  330R  [R_0603_1608Metric]
R4  330R  [R_0603_1608Metric]
R5  330R  [R_0603_1608Metric]
R6  10k  [R_0603_1608Metric]
R7  10k  [R_0603_1608Metric]
R8  1k  [R_0603_1608Metric]
R9  1k  [R_0603_1608Metric]
R10  1k  [R_0603_1608Metric]
R11  1k  [R_0603_1608Metric]
R12  1k  [R_0603_1608Metric]
R13  1k  [R_0603_1608Metric]
R14  1k  [R_0603_1608Metric]
R15  1k  [R_0603_1608Metric]
R16  1k  [R_0603_1608Metric]
R17  1k  [R_0603_1608Metric]
R18  1k  [R_0603_1608Metric]
R19  1k  [R_0603_1608Metric]
R20  1k  [R_0603_1608Metric]
R21  1k  [R_0603_1608Metric]
R22  1k  [R_0603_1608Metric]
R23  1k  [R_0603_1608Metric]
R24  1k  [R_0603_1608Metric]
R25  1k  [R_0603_1608Metric]
R27  1k  [R_0603_1608Metric]
R28  1k  [R_0603_1608Metric]
R29  1k  [R_0603_1608Metric]
R30  1k  [R_0603_1608Metric]
R31  1k  [R_0603_1608Metric]
R37  1k  [R_0603_1608Metric]
SW1  TSA06141-225B532CA-3C00  [TL1105]  (value not drawn)
SW2  TSA06141-225B532CA-3C00  [TL1105]  (value not drawn)
SW3  TSA06141-225B532CA-3C00  [TL1105]  (value not drawn)
U2  74HC595PW,118  [TSSOP-16_4.4x5mm_P0.65mm]  (value not drawn)
U3  74HC595PW,118  [TSSOP-16_4.4x5mm_P0.65mm]  (value not drawn)
U4  74HC595PW,118  [TSSOP-16_4.4x5mm_P0.65mm]

### Ports
BTN_DOWN (see KNX-MCU-CONTROL_V0.2[1A]), BTN_ENTER (see KNX-MCU-CONTROL_V0.2[1A]), BTN_UP (see KNX-MCU-CONTROL_V0.2[1A]), Led_Shift_~{OE} (see KNX-MCU-CONTROL_V0.2[2A]), Led_ShiftReg_Latch (see KNX-MCU-CONTROL_V0.2[2A]), Led_ShiftRegCLK (see KNX-MCU-CONTROL_V0.2[2A]), Led_ShiftRegDATA (see KNX-MCU-CONTROL_V0.2[2A])

### Nets
+3V3: C26.1 C27.1 C29.1 C30.1 C31.1 C32.1 SW1.1 SW1.2 SW2.1 SW2.2 SW3.1 SW3.2 U2.10(~{{SRCLR}}) U2.16(VCC) U3.10(~{{SRCLR}}) U3.16(VCC) U4.10(~{{SRCLR}}) U4.16(VCC)
GND: C30.2 C31.2 C32.2 D1.1(K) D4.1(K) D5.1(K) D6.1(K) D7.1(K) D8.1(K) D9.1(K) D10.1(K) D12.1(K) D13.1(K) D14.1(K) D15.1(K) D16.1(K) D17.1(K) D18.1(K) D19.1(K) D20.1(K) D21.1(K) D22.1(K) D23.1(K) D24.1(K) D25.1(K) D26.1(K) D27.1(K) R1.2 R6.2 R7.2 U2.8(GND) U3.8(GND) U4.8(GND)
BTN_DOWN: R5.1 ; port BTN_DOWN
BTN_ENTER: R4.1 ; port BTN_ENTER
BTN_UP: R2.1 ; port BTN_UP
Led_ShiftRegDATA: U2.14(SER) ; port Led_ShiftRegDATA
ShiftReg_Latch: U2.12(RCLK) U3.12(RCLK) U4.12(RCLK) ; port Led_ShiftReg_Latch
ShiftReg_~{{OE}}: U2.13(~{{OE}}) U3.13(~{{OE}}) U4.13(~{{OE}}) ; port Led_Shift_~{OE}
ShiftRegCLK: U2.11(SRCLK) U3.11(SRCLK) U4.11(SRCLK) ; port Led_ShiftRegCLK
NetC26_2: C26.2 R1.1 R2.2 SW1.3 SW1.4
NetC27_2: C27.2 R4.2 R6.1 SW2.3 SW2.4
NetC29_2: C29.2 R5.2 R7.1 SW3.3 SW3.4
NetD1_2: D1.2(A) R8.2
NetD4_2: D4.2(A) R9.2
NetD5_2: D5.2(A) R10.2
NetD6_2: D6.2(A) R11.2
NetD7_2: D7.2(A) R12.2
NetD8_2: D8.2(A) R13.2
NetD9_2: D9.2(A) R14.2
NetD10_2: D10.2(A) R15.2
NetD12_2: D12.2(A) R16.2
NetD13_2: D13.2(A) R17.2
NetD14_2: D14.2(A) R18.2
NetD15_2: D15.2(A) R19.2
NetD16_2: D16.2(A) R20.2
NetD17_2: D17.2(A) R21.2
NetD18_2: D18.2(A) R22.2
NetD19_2: D19.2(A) R23.2
NetD20_2: D20.2(A) R24.2
NetD21_2: D21.2(A) R25.2
NetD22_2: D22.2(A) R27.2
NetD23_2: D23.2(A) R28.2
NetD24_2: D24.2(A) R29.2
NetD25_2: D25.2(A) R30.2
NetD26_2: D26.2(A) R31.2
NetD27_2: D27.2(A) R37.2
NetR8_1: R8.1 U2.15(QA)
NetR9_1: R9.1 U2.1(QB)
NetR10_1: R10.1 U2.2(QC)
NetR11_1: R11.1 U2.3(QD)
NetR12_1: R12.1 U2.4(QE)
NetR13_1: R13.1 U2.5(QF)
NetR14_1: R14.1 U2.6(QG)
NetR15_1: R15.1 U2.7(QH)
NetR16_1: R16.1 U3.15(QA)
NetR17_1: R17.1 U3.1(QB)
NetR18_1: R18.1 U3.2(QC)
NetR19_1: R19.1 U3.3(QD)
NetR20_1: R20.1 U3.4(QE)
NetR21_1: R21.1 U3.5(QF)
NetR22_1: R22.1 U3.6(QG)
NetR23_1: R23.1 U3.7(QH)
NetR24_1: R24.1 U4.15(QA)
NetR25_1: R25.1 U4.1(QB)
NetR27_1: R27.1 U4.2(QC)
NetR28_1: R28.1 U4.3(QD)
NetR29_1: R29.1 U4.4(QE)
NetR30_1: R30.1 U4.5(QF)
NetR31_1: R31.1 U4.6(QG)
NetR37_1: R37.1 U4.7(QH)
NetU2_9: U2.9(QH') U3.14(SER)
NetU3_9: U3.9(QH') U4.14(SER)

Not connected (* = marked no-connect by the designer): U4 9(QH')

### Notes on the sheet
- 1
- 2
- 3
- 4
- 5
- 6
- A
- B
- C
- D
- Title:
- File: UI_BUTTON_LED.kicad_sch
- Sheet: /
- KiCad E.D.A.  kicad (5.1.4)-1
- Size: A4
- Date:
- Rev:
- Id: 1/1

### Library data of the parts
C26 C27 C29 = C_3: as C25 on sheet KNX-MCU-CONTROL_V0.2; Value: 100nF; Footprint: Capacitor_SMD:C_0603_1608Metric
C30-C32 = C_1: Manufacturer Part Number: CC0603KRX7R9BB104; Manufacturer: YAGEO; Value: 100nF; Footprint: Capacitor_SMD:C_0603_1608Metric
D1 D4-D10 D12-D27 = LED: Manufacturer: LITEON; Manufacturer Part Number: LTST-C190KFKT-5A; Value: LED; Footprint: LED_SMD:LED_0603_1608Metric
R1 R6 R7 = R: Manufacturer: FOJAN; Manufacturer Part Number: FRC0603J103TS; Value: 10k; Footprint: Resistor_SMD:R_0603_1608Metric
R2 R4 R5 = R: Manufacturer: FOJAN; Manufacturer Part Number: FRC0603J331 TS; Value: 330R; Footprint: Resistor_SMD:R_0603_1608Metric
R8-R25 R27-R31 R37 = R: Manufacturer: YAGEO; Manufacturer Part Number: RC0603JR-071KL; Value: 1k; Footprint: Resistor_SMD:R_0603_1608Metric
SW1-SW3 = TL1105BF160Q: Through Hole-4P,8.2x7.6mm; Manufacturer: Khon; Manufacturer Part Number: TSA06141-225B532CA-3C00
U2-U4 = 74HC595: Manufacturer: Nexperia; Manufacturer Part Number: 74HC595PW,118; Value: 74HC595PW,118; Footprint: Package_SO:TSSOP-16_4.4x5mm_P0.65mm

## Nets that join several sheets
+3V3: KNX-MCU-CONTROL_V0.2 (C25.2 J2.2 J3.1 SW5.2), Transceiver for KNx (7 pins), Connectors (J10.2), MCU (13 pins), UI_BUTTON_LED (18 pins)
+12V: Transceiver for KNx (C16.2 R36.2 R38.1 U1.13), Connectors (J10.1)
GND: KNX-MCU-CONTROL_V0.2 (8 pins), Transceiver for KNx (26 pins), Connectors (J10.3), MCU (16 pins), UI_BUTTON_LED (33 pins)
-A: KNX-MCU-CONTROL_V0.2 (J1.2), Transceiver for KNx (D2.2 L4.2)
A: KNX-MCU-CONTROL_V0.2 (J1.1), Transceiver for KNx (D2.1 L4.1)
BTN_DOWN: MCU (IC1.3), UI_BUTTON_LED (R5.1)
BTN_ENTER: MCU (IC1.2), UI_BUTTON_LED (R4.1)
BTN_UP: MCU (IC1.1), UI_BUTTON_LED (R2.1)
CLK: KNX-MCU-CONTROL_V0.2 (J2.3 J3.4), MCU (IC1.32)
DIO: KNX-MCU-CONTROL_V0.2 (J2.4 J3.2), MCU (IC1.33)
Led_ShiftRegDATA: MCU (IC1.23), UI_BUTTON_LED (U2.14)
P000: Connectors (R93.1), MCU (IC1.64)
P001: Connectors (R94.1), MCU (IC1.63)
P003: Connectors (R92.1), MCU (IC1.61)
P004: Connectors (R91.1), MCU (IC1.60)
P104: KNX-MCU-CONTROL_V0.2 (R96.2), MCU (IC1.44)
P105: KNX-MCU-CONTROL_V0.2 (R95.2), MCU (IC1.43)
P109: KNX-MCU-CONTROL_V0.2 (R97.2), MCU (IC1.34)
P110: KNX-MCU-CONTROL_V0.2 (R98.2), MCU (IC1.35)
Relay_ADC: KNX-MCU-CONTROL_V0.2 (C24.2 R43.2 R44.1), MCU (IC1.50)
RELAY_CAP_ADC: KNX-MCU-CONTROL_V0.2 (R43.1), Connectors (J10.4)
RES: KNX-MCU-CONTROL_V0.2 (J2.5 J3.3), MCU (C21.2 IC1.25 R32.1 SW4.1)
RESETb: KNX-MCU-CONTROL_V0.2 (R96.1), Transceiver for KNx (U1.37)
SAVEb: KNX-MCU-CONTROL_V0.2 (R95.1), Transceiver for KNx (U1.36)
SDI/RXD: KNX-MCU-CONTROL_V0.2 (R97.1), Transceiver for KNx (U1.27)
SDO/TXD: KNX-MCU-CONTROL_V0.2 (R98.1), Transceiver for KNx (U1.28)
ShiftReg_Latch: MCU (IC1.21), UI_BUTTON_LED (U2.12 U3.12 U4.12)
ShiftReg_~{{OE}}: MCU (IC1.20), UI_BUTTON_LED (U2.13 U3.13 U4.13)
ShiftRegCLK: MCU (IC1.22), UI_BUTTON_LED (U2.11 U3.11 U4.11)
User_BTN: KNX-MCU-CONTROL_V0.2 (R99.2), MCU (IC1.4)
User_LED: KNX-MCU-CONTROL_V0.2 (R26.1), MCU (IC1.62)
VFILT: KNX-MCU-CONTROL_V0.2 (R41.1), Transceiver for KNx (5 pins)
VFILT_ADC: KNX-MCU-CONTROL_V0.2 (C23.2 R41.2 R42.1), MCU (IC1.51)